# Altium schematic sheet MCU.SchDoc: CC2538
size A4; SheetNumber: 1; SheetTotal: 4
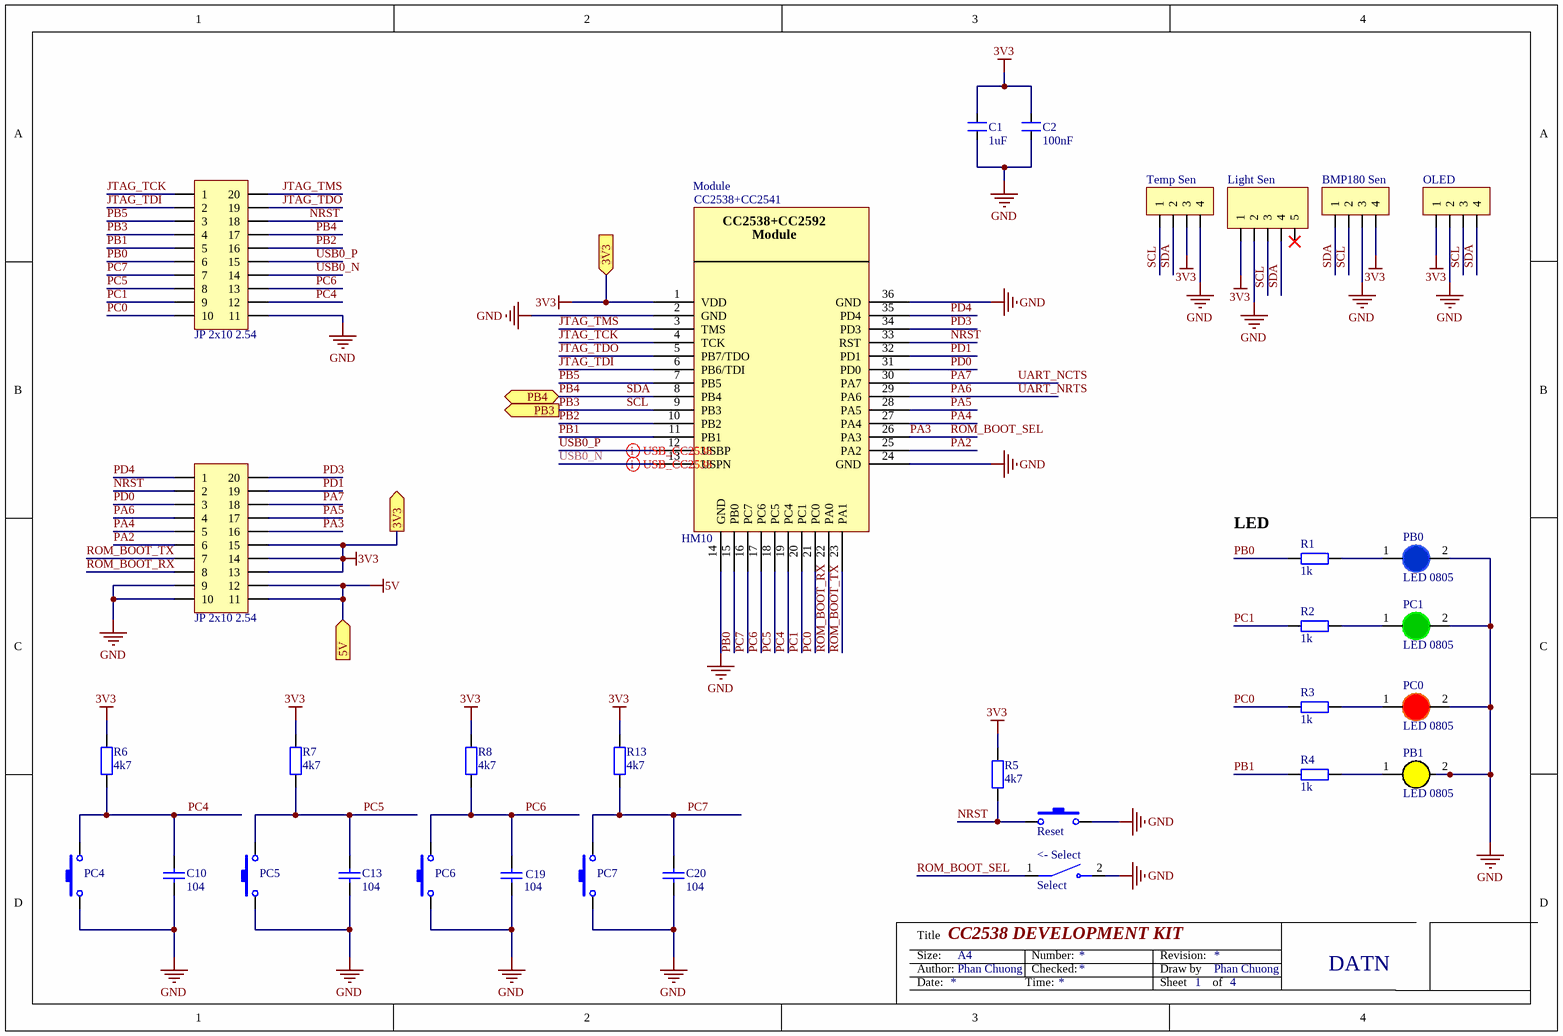
[diagram p0: MCU.SchDoc]

## Parts
<-_Select  Select  [SW_KAE01SGGT]
BMP180_Sens  BMP180 Sen  [JP 1x4 CT]
C1  1uF  [SM-0805]
C2  100nF  [SM-0805]
C10  104  [tu 0805]
C13  104  [tu 0805]
C19  104  [tu 0805]
C20  104  [tu 0805]
JP7  JP 2x10 2.54  [JP 2x10 DT]
JP9  JP 2x10 2.54  [JP 2x10 DT]
Light_Sens  Light Sen  [JP 1x5 CT]
Module  HM10  [CC2538+CC2541]
OLED  OLED  [JP 1x4 CT]
PB0  LED 0805  [LED-0805-Blue]
PB1  LED 0805  [LED-0805-Yellow]
PC0  LED 0805  [LED-0805-Red]
PC1  LED 0805  [LED-0805-Green]
PC4  SW-SMD  [SW-SMD]  (value not drawn)
PC5  SW-SMD  [SW-SMD]  (value not drawn)
PC6  SW-SMD  [SW-SMD]  (value not drawn)
PC7  SW-SMD  [SW-SMD]  (value not drawn)
R1  1k  [RES-SMD-0805]
R2  1k  [RES-SMD-0805]
R3  1k  [RES-SMD-0805]
R4  1k  [RES-SMD-0805]
R5  4k7  [tro smd 0805]
R6  4k7  [tro smd 0805]
R7  4k7  [tro smd 0805]
R8  4k7  [tro smd 0805]
R13  4k7  [tro smd 0805]
Reset  SW-SMD  [SW-SMD]  (value not drawn)
Temp_sens  Temp Sen  [JP 1x4 CT]

## Ports
3V3 (in), 3V3 (out), 5V (in), PB3 (out), PB4 (bidir)

## Nets
3V3: BMP180_Sens.4 C1.2 C2.2 JP9.13 JP9.14 JP9.15 Light_Sens.1 Module.1(VDD) OLED.1 R5.2 R6.2 R7.2 R8.2 R13.2 Temp_sens.3 ; port 3V3
5V: JP9.11 JP9.12 ; port 5V
GND: <-_Select.2 BMP180_Sens.3 C1.1 C2.1 C10.2 C13.2 C19.2 C20.2 JP7.11 JP9.9 JP9.10 Light_Sens.2 Module.2(GND) Module.14(GND) Module.24(GND) Module.36(GND) OLED.2 PB0.2(K) PB1.2(K) PC0.2(K) PC1.2(K) PC4.1 PC5.1 PC6.1 PC7.1 Reset.2 Temp_sens.4
JTAG_TCK: JP7.1 Module.4(TCK)
JTAG_TDI: JP7.2 Module.6(PB6/TDI)
JTAG_TDO: JP7.19 Module.5(PB7/TDO)
JTAG_TMS: JP7.20 Module.3(TMS)
NRST: JP7.18 JP9.2 Module.33(RST) R5.1 Reset.1
PA2: JP9.6 Module.25(PA2)
PA3: <-_Select.1 JP9.16 Module.26(PA3)  [also labelled ROM_BOOT_SEL]
PA4: JP9.5 Module.27(PA4)
PA5: JP9.17 Module.28(PA5)
PA6: JP9.4 Module.29(PA6)  [also labelled UART_NRTS]
PA7: JP9.18 Module.30(PA7)  [also labelled UART_NCTS]
PB0: JP7.6 Module.15(PB0) R1.1
PB1: JP7.5 Module.11(PB1) R4.1
PB2: JP7.16 Module.10(PB2)
PB3: BMP180_Sens.2 JP7.4 Light_Sens.3 Module.9(PB3) OLED.3 Temp_sens.1 ; port PB3  [also labelled SCL]
PB4: BMP180_Sens.1 JP7.17 Light_Sens.4 Module.8(PB4) OLED.4 Temp_sens.2 ; port PB4  [also labelled SDA]
PB5: JP7.3 Module.7(PB5)
PC0: JP7.10 Module.21(PC0) R3.1
PC1: JP7.9 Module.20(PC1) R2.1
PC4: C10.1 JP7.12 Module.19(PC4) PC4.2 R6.1
PC5: C13.1 JP7.8 Module.18(PC5) PC5.2 R7.1
PC6: C19.1 JP7.13 Module.17(PC6) PC6.2 R8.1
PC7: C20.1 JP7.7 Module.16(PC7) PC7.2 R13.1
PD0: JP9.3 Module.31(PD0)
PD1: JP9.19 Module.32(PD1)
PD3: JP9.20 Module.34(PD3)
PD4: JP9.1 Module.35(PD4)
ROM_BOOT_RX: JP9.8 Module.22(PA0)
ROM_BOOT_TX: JP9.7 Module.23(PA1)
USB0_N: JP7.14 Module.13(USPN)
USB0_P: JP7.15 Module.12(USBP)
NetPB0_1: PB0.1(A) R1.2
NetPB1_1: PB1.1(A) R4.2
NetPC0_1: PC0.1(A) R3.2
NetPC1_1: PC1.1(A) R2.2

Not connected (* = marked no-connect by the designer): Light_Sens 5*

## Layout directives
differential pair: USB0_N, USB0_P

## Notes on the sheet
- (near R1) LED
- Title
- Size:
- Date:
- Author:
- CC2538 DEVELOPMENT KIT
- A4
- Phan Chuong
- Time:
- Number:
- Checked:
- Revision:
- Sheet
- Draw by
- of
- DATN
- (in symbol CC2538 HM10) CC2538+CC2541; CC2538+CC2592

## Library data of the parts
<-_Select = KAE01SGGT: Dip Switch SPST 1 Position Surface Mount Slide (Standard) Actuator 25mA 24VDC; MF: E-Switch; Check_prices: https://www.snapeda.com/parts/KAE01SGGT/E-Switch/view-part/?ref=eda; Value: *; Availability: In Stock; MP: KAE01SGGT; Price: None; Package: None; SnapEDA_Link: https://www.snapeda.com/parts/KAE01SGGT/E-Switch/view-part/?ref=snap; Purchase-URL: https://pricing.snapeda.com/search/part/KAE01SGGT/?ref=eda
BMP180_Sens OLED Temp_sens = JP 1x4 2.54 Cai Thang: Cắm; Ten_Linh_Kien: Jump Đơn Cái 2.54MM 1x20P Thẳng; Don_Vi: Con; Ma_Hang: MH004006; Ghi_Chu: *; Kieu_Chan: *; Chung_Loai: Cắm
C1 C2 = CM: Cap SMD; Value: 103
C10 C13 C19 C20 = Tu 0805 104 50V 10%: Dán; Don_Vi: Con; So_Chan: 2; Ten_Linh_Kien: Tụ 0805 104-100nF 10% 50V; Ma_Hang: MH004551; Chung_Loai: Dán; Kieu_Chan: *
JP7 JP9 = JP 2x10 2.54 Duc Thang: Cắm; Ten_Linh_Kien: Jump Đôi Đực 2.54MM 2x40P Thẳng 11MM; Don_Vi: Con; Ma_Hang: MH002686; Ghi_Chu: *; Kieu_Chan: *; Chung_Loai: Cắm
Light_Sens = JP 1x5 2.54 Cai Thang: Cắm; Ten_Linh_Kien: Jump Đơn Cái 2.54MM 1x20P Thẳng; Don_Vi: Con; Ma_Hang: MH004006; Ghi_Chu: *; Kieu_Chan: *; Chung_Loai: Cắm
Module = CC2538 HM10: BLE HM10
PB0 = LED 0805 Xanh Duong: Dán; Don_Vi: Con; Ma_Hang: MH002327; Ten_Linh_Kien: LED 0805 Màu Xanh Dương (Blue); Ghi_Chu: *; Kieu_Chan: *; Chung_Loai: Dán
PB1 = LED 0805 Vang: Dán; Don_Vi: Con; Ma_Hang: MH002329; Ten_Linh_Kien: LED 0805 Màu Vàng ( Yellow); Ghi_Chu: *; Kieu_Chan: *; Chung_Loai: Dán
PC0 = LED 0805 Do: Dán; Don_Vi: Con; Ma_Hang: MH000897; Ten_Linh_Kien: LED 0805 Màu Đỏ (Red); Ghi_Chu: *; Kieu_Chan: *; Chung_Loai: Dán
PC1 = LED 0805 Xanh La: Dán; Don_Vi: Con; Ma_Hang: MH002326; Ten_Linh_Kien: LED 0805 Màu Xanh Lá (Green); Ghi_Chu: *; Kieu_Chan: *; Chung_Loai: Dán
PC4-PC7 Reset = SW-SMD: Switch; Published: 24-Mar-1999; LatestRevisionDate: 17-Jul-2002; LatestRevisionNote: Re-released for DXP Platform.; PackageReference: SPST-2; Publisher: Altium Limited
R1-R4 = R: Resistor R1/4W
R5-R8 R13 = Tro 0805 1% 0.22R: Dán; Don_Vi: Con; So_Chan: 2; Ten_Linh_Kien: Trở 0805 1% 0.22R; Ma_Hang: MH005466; Chung_Loai: Dán; Kieu_Chan: *